# Altium schematic sheet Kraken.SchDoc
size Letter; SheetNumber: 7; SheetTotal: 7
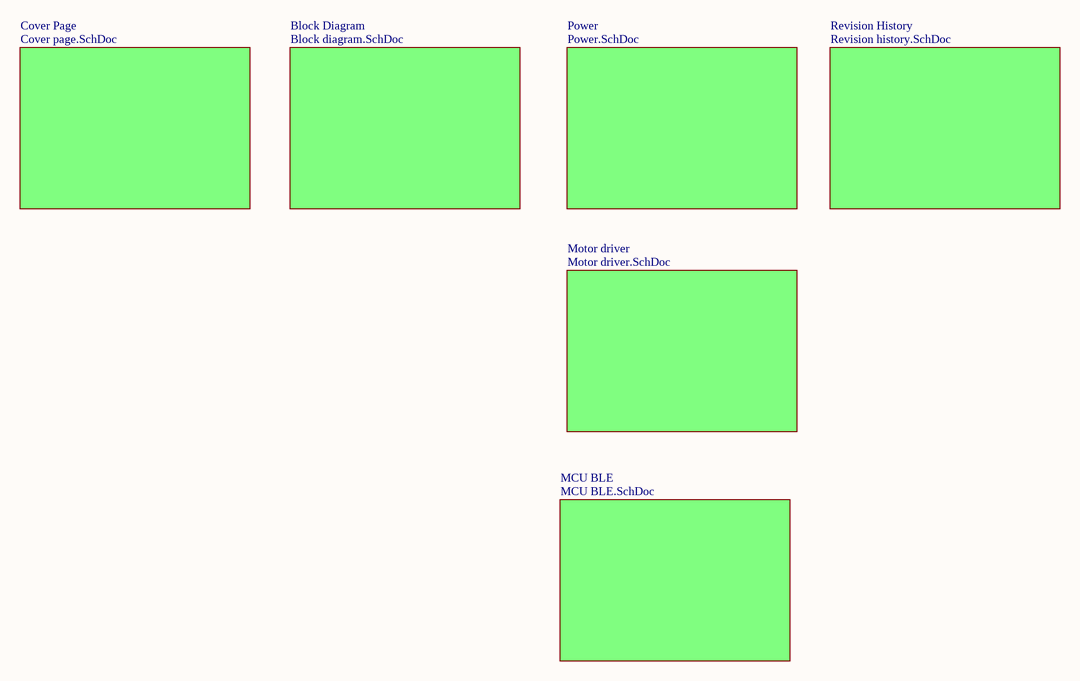
[diagram p0: Kraken.SchDoc]

## Sub-sheets
Block Diagram = Block diagram.SchDoc: no entries
Cover Page = Cover page.SchDoc: no entries
MCU BLE = MCU BLE.SchDoc: no entries
Motor driver = Motor driver.SchDoc: no entries
Power = Power.SchDoc: no entries
Revision History = Revision history.SchDoc: no entries

## Notes on the sheet
- Proyecto:
- Autor:
- Carné:
- Documento:
- Curso:
- Revision:
- Fecha:
- Tamaño:
- Carta
- Hoja:      de